# Altium schematic sheet PowerPanel_3_LowV_Monitors.SchDoc
size 594 x 420 mm; SheetNumber: 4; SheetTotal: 6
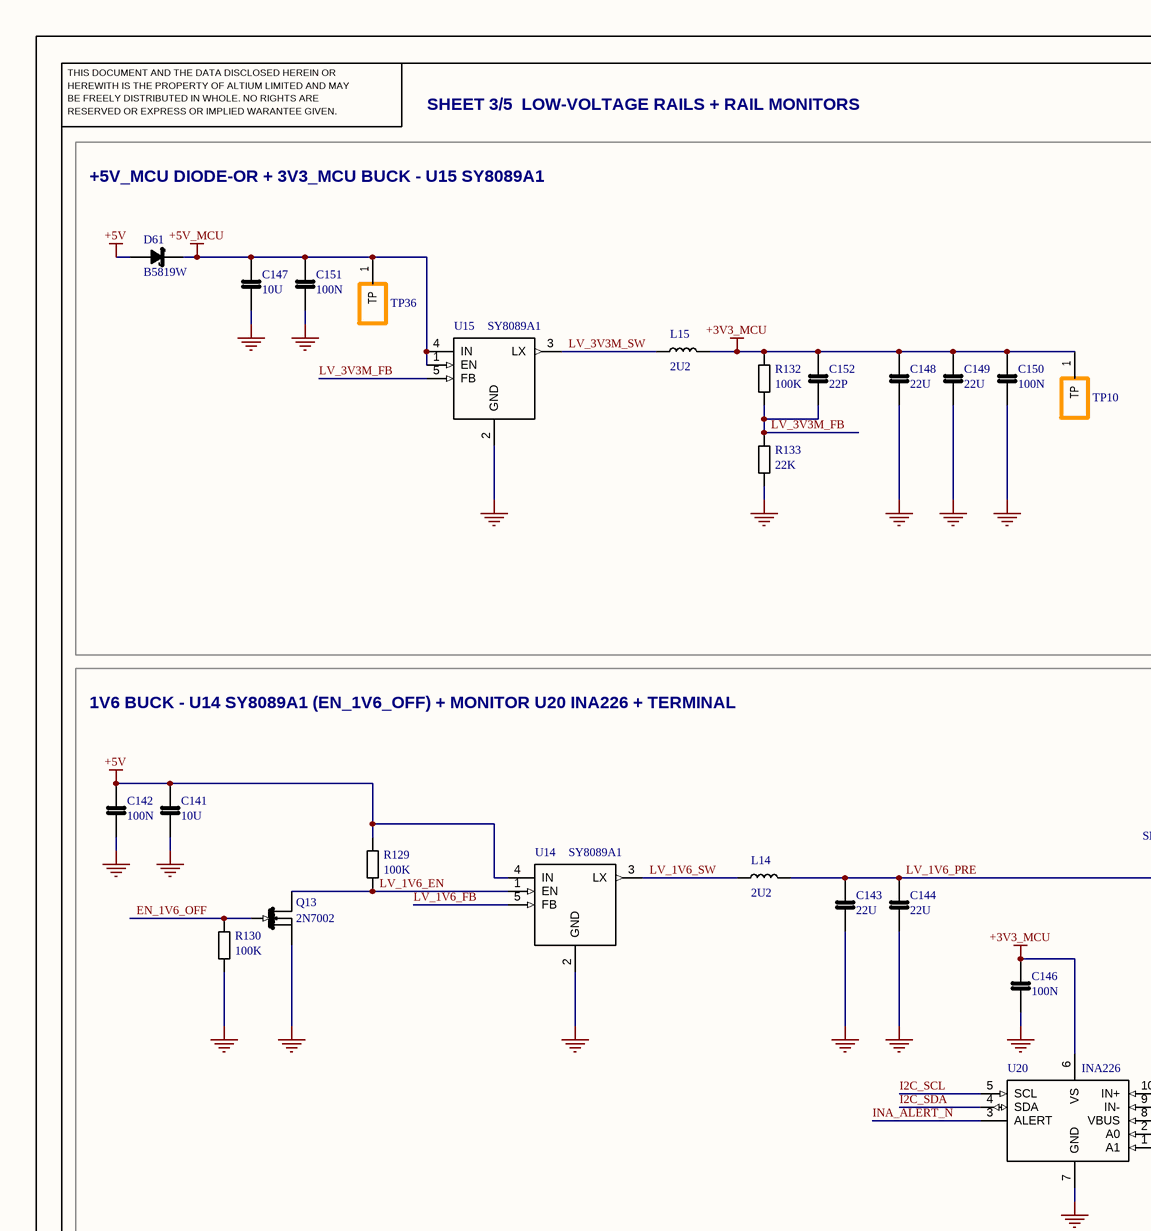
[diagram p0: PowerPanel_3_LowV_Monitors.SchDoc, top left]
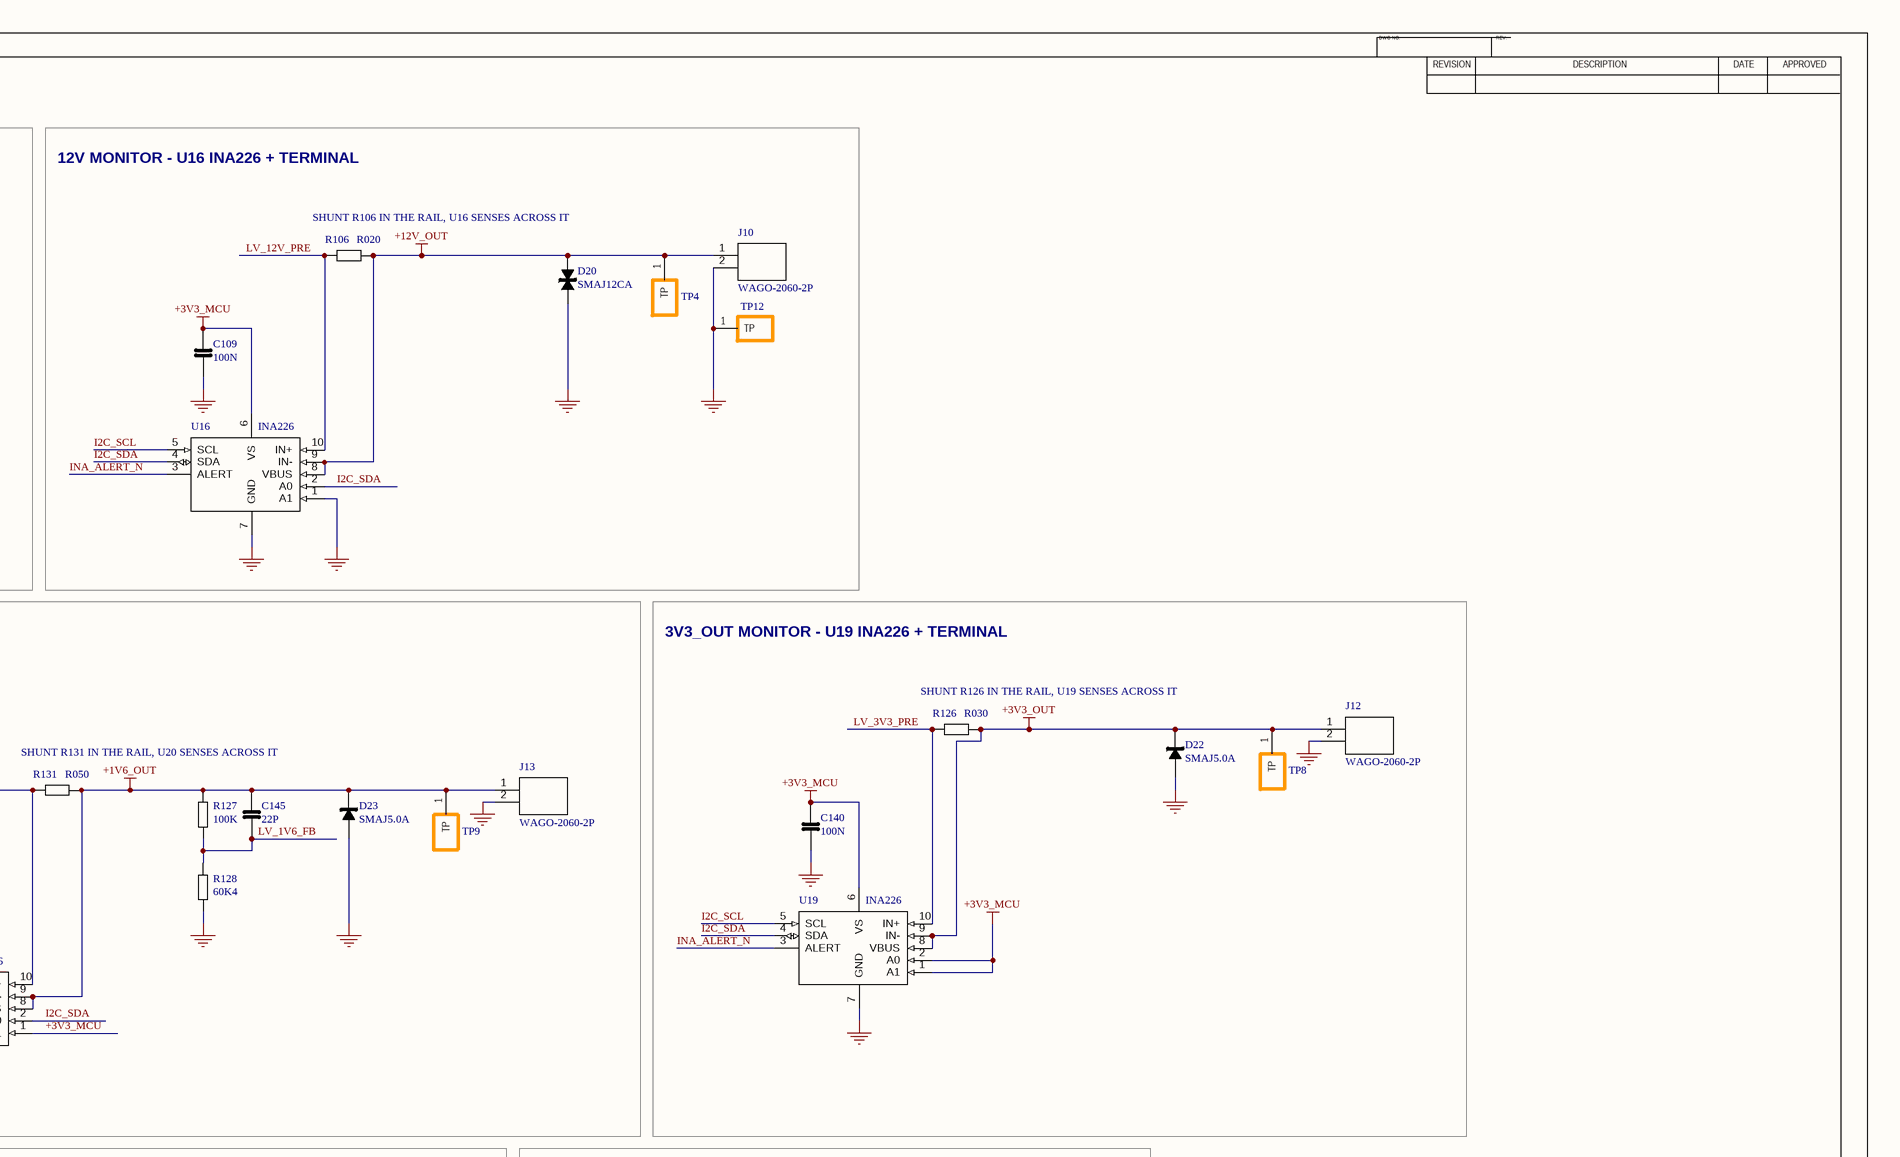
[diagram p1: PowerPanel_3_LowV_Monitors.SchDoc, top right]
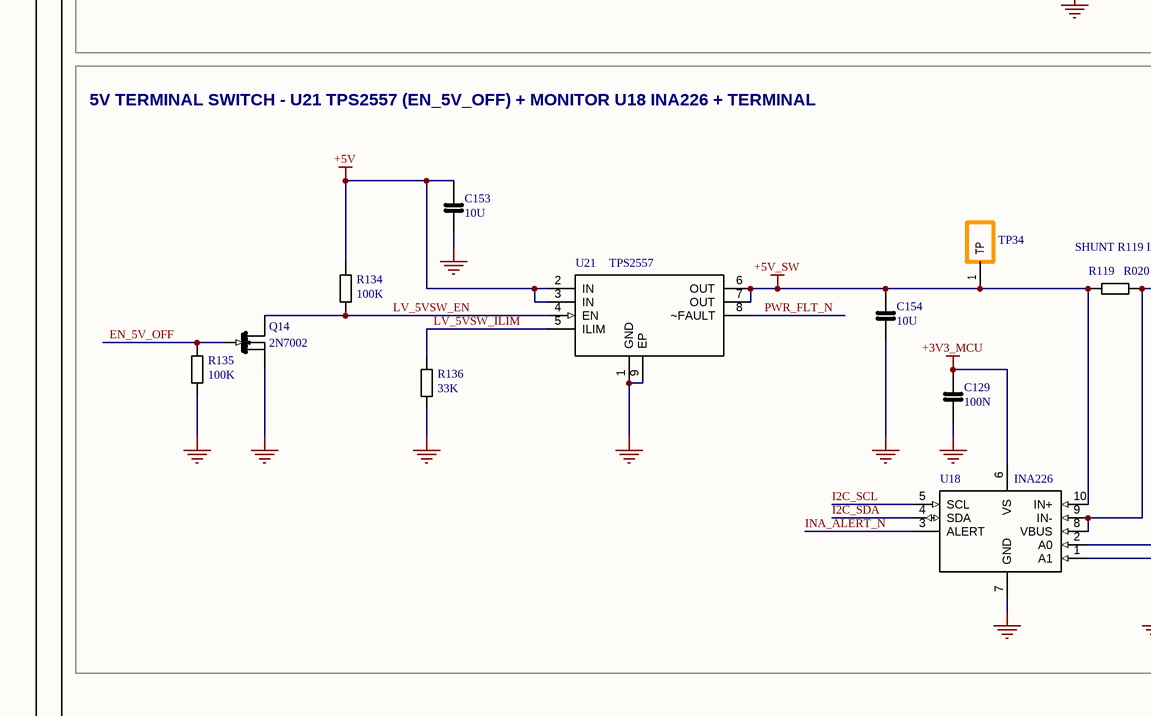
[diagram p2: PowerPanel_3_LowV_Monitors.SchDoc, bottom left]
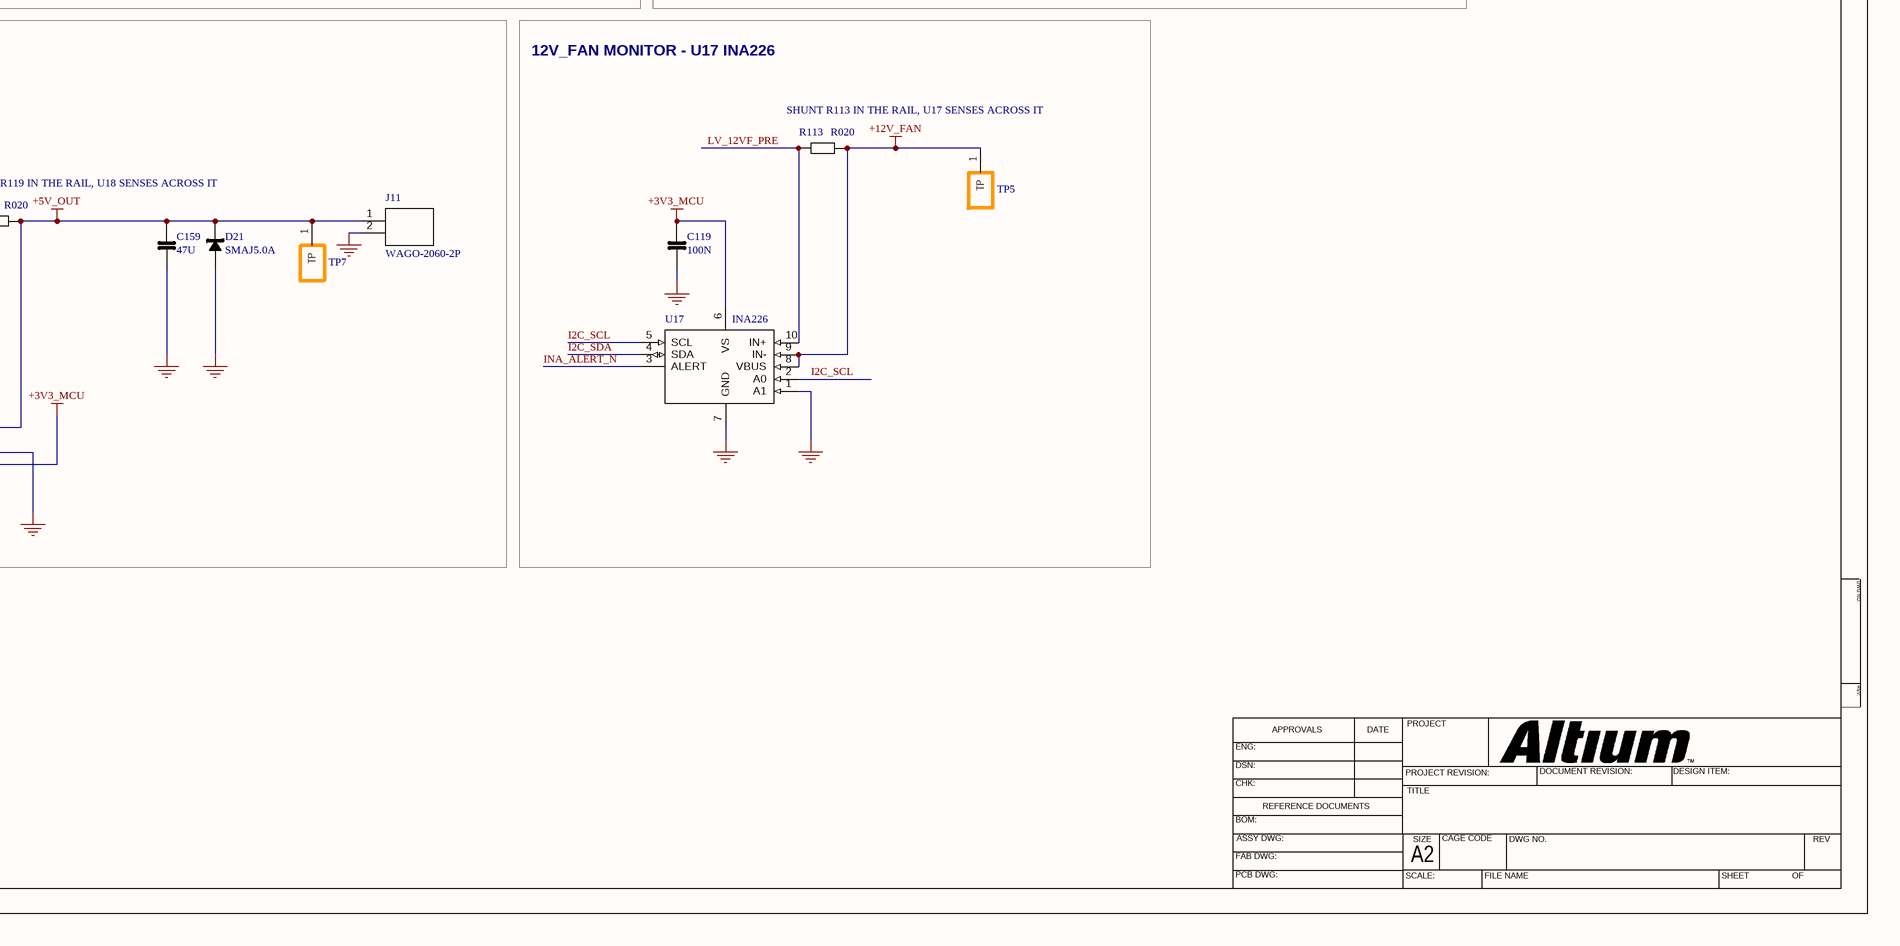
[diagram p3: PowerPanel_3_LowV_Monitors.SchDoc, bottom right]

## Parts
C109  100N  [CAP0603]
C119  100N  [CAP0603]
C129  100N  [CAP0603]
C140  100N  [CAP0603]
C141  10U  [CAP0805]
C142  100N  [CAP0603]
C143  22U  [CAP0805]
C144  22U  [CAP0805]
C145  22P  [CAP0603]
C146  100N  [CAP0603]
C147  10U  [CAP0805]
C148  22U  [CAP0805]
C149  22U  [CAP0805]
C150  100N  [CAP0603]
C151  100N  [CAP0603]
C152  22P  [CAP0603]
C153  10U  [CAP0805]
C154  10U  [CAP0805]
C159  47U  [CAP1206]
D20  SMAJ12CA  [SMA]
D21  SMAJ5.0A  [SMA]
D22  SMAJ5.0A  [SMA]
D23  SMAJ5.0A  [SMA]
D61  B5819W  [SOD-123]
J10  WAGO-2060-2P  [TERM_WAGO_2060-452]
J11  WAGO-2060-2P  [TERM_WAGO_2060-452]
J12  WAGO-2060-2P  [TERM_WAGO_2060-452]
J13  WAGO-2060-2P  [TERM_WAGO_2060-452]
L14  2U2  [L_4030]
L15  2U2  [L_4030]
Q13  2N7002  [SOT-23-3]
Q14  2N7002  [SOT-23-3]
R106  R020  [R1206]
R113  R020  [R1206]
R119  R020  [R1206]
R126  R030  [R1206]
R127  100K  [R0603]
R128  60K4  [R0603]
R129  100K  [R0603]
R130  100K  [R0603]
R131  R050  [R1206]
R132  100K  [R0603]
R133  22K  [R0603]
R134  100K  [R0603]
R135  100K  [R0603]
R136  33K  [R0603]
TP4  TP  [TESTPOINT]  (value not drawn)
TP5  TP  [TESTPOINT]  (value not drawn)
TP7  TP  [TESTPOINT]  (value not drawn)
TP8  TP  [TESTPOINT]  (value not drawn)
TP9  TP  [TESTPOINT]  (value not drawn)
TP10  TP  [TESTPOINT]  (value not drawn)
TP12  TP  [TESTPOINT]  (value not drawn)
TP34  TP  [TESTPOINT]  (value not drawn)
TP36  TP  [TESTPOINT]  (value not drawn)
U14  SY8089A1  [SOT-23-5]
U15  SY8089A1  [SOT-23-5]
U16  INA226  [MSOP-10]
U17  INA226  [MSOP-10]
U18  INA226  [MSOP-10]
U19  INA226  [MSOP-10]
U20  INA226  [MSOP-10]
U21  TPS2557  [VSON-8_3X3_EP]

## Blocks framed on the sheet
+5V_MCU DIODE-OR + 3V3_MCU BUCK - U15 SY8089A1: C147-C152 D61 L15 R132 R133 TP10 TP36 U15
12V MONITOR - U16 INA226 + TERMINAL: C109 D20 J10 R106 TP4 TP12 U16
SHUNT R131 IN THE RAIL, U20 SENSES ACROSS IT: C141-C146 D23 J13 L14 Q13 R127-R131 TP9 U14 U20
3V3_OUT MONITOR - U19 INA226 + TERMINAL: C140 D22 J12 R126 TP8 U19
SHUNT R119 IN THE RAIL, U18 SENSES ACROSS IT: C129 C153 C154 C159 D21 J11 Q14 R119 R134-R136 TP7 TP34 U18 U21
12V_FAN MONITOR - U17 INA226: C119 R113 TP5 U17

## Nets
+1V6_OUT: C145.1 D23.1(K) J13.1 R127.1 R131.2 TP9.1(TP) U20.8(VBUS) U20.9(IN-)
+3V3_MCU: C109.1 C119.1 C129.1 C140.1 C146.1 C148.1 C149.1 C150.1 C152.1 L15.2 R132.1 TP10.1(TP) U16.6(VS) U17.6(VS) U18.1(A1) U18.6(VS) U19.1(A1) U19.2(A0) U19.6(VS) U20.1(A1) U20.6(VS)
+3V3_OUT: D22.1(K) J12.1 R126.2 TP8.1(TP) U19.8(VBUS) U19.9(IN-)
+5V: C141.1 C142.1 C153.1 D61.2(A) R129.1 R134.1 U14.4(IN) U21.2(IN) U21.3(IN)
+5V_MCU: C147.1 C151.1 D61.1(K) TP36.1(TP) U15.1(EN) U15.4(IN)
+5V_OUT: C159.1 D21.1(K) J11.1 R119.2 TP7.1(TP) U18.8(VBUS) U18.9(IN-)
+5V_SW: C154.1 R119.1 TP34.1(TP) U18.10(IN+) U21.6(OUT) U21.7(OUT)
+12V_FAN: R113.2 TP5.1(TP) U17.8(VBUS) U17.9(IN-)
+12V_OUT: D20.1 J10.1 R106.2 TP4.1(TP) U16.8(VBUS) U16.9(IN-)
GND: C109.2 C119.2 C129.2 C140.2 C141.2 C142.2 C143.2 C144.2 C146.2 C147.2 C148.2 C149.2 C150.2 C151.2 C153.2 C154.2 C159.2 D20.2 D21.2(A) D22.2(A) D23.2(A) J10.2 J11.2 J12.2 J13.2 Q13.2(S) Q14.2(S) R128.2 R130.2 R133.2 R135.2 R136.2 TP12.1(TP) U14.2(GND) U15.2(GND) U16.1(A1) U16.7(GND) U17.1(A1) U17.7(GND) U18.2(A0) U18.7(GND) U19.7(GND) U20.7(GND) U21.1(GND) U21.9(EP)
EN_1V6_OFF: Q13.1(G) R130.1
EN_5V_OFF: Q14.1(G) R135.1
I2C_SCL: U16.5(SCL) U17.2(A0) U17.5(SCL) U18.5(SCL) U19.5(SCL) U20.5(SCL)
I2C_SDA: U16.2(A0) U16.4(SDA) U17.4(SDA) U18.4(SDA) U19.4(SDA) U20.2(A0) U20.4(SDA)
INA_ALERT_N: U16.3(ALERT) U17.3(ALERT) U18.3(ALERT) U19.3(ALERT) U20.3(ALERT)
LV_1V6_EN: Q13.3(D) R129.2 U14.1(EN)
LV_1V6_FB: C145.2 R127.2 R128.1 U14.5(FB)
LV_1V6_PRE: C143.1 C144.1 L14.2 R131.1 U20.10(IN+)
LV_1V6_SW: L14.1 U14.3(LX)
LV_3V3_PRE: R126.1 U19.10(IN+)
LV_3V3M_FB: C152.2 R132.2 R133.1 U15.5(FB)
LV_3V3M_SW: L15.1 U15.3(LX)
LV_5VSW_EN: Q14.3(D) R134.2 U21.4(EN)
LV_5VSW_ILIM: R136.1 U21.5(ILIM)
LV_12V_PRE: R106.1 U16.10(IN+)
LV_12VF_PRE: R113.1 U17.10(IN+)
PWR_FLT_N: U21.8(~FAULT)

## Notes on the sheet
- DWG NO:
- REV:
- THIS DOCUMENT AND THE DATA DISCLOSED HEREIN OR
- HEREWITH IS THE PROPERTY OF ALTIUM LIMITED AND MAY
- BE FREELY DISTRIBUTED IN WHOLE. NO RIGHTS ARE
- RESERVED OR EXPRESS OR IMPLIED WARANTEE GIVEN.
- SHEET 3/5  LOW-VOLTAGE RAILS + RAIL MONITORS
- REVISION
- DESCRIPTION
- DATE
- APPROVED
- SHUNT R106 IN THE RAIL, U16 SENSES ACROSS IT
- 1V6 BUCK - U14 SY8089A1 (EN_1V6_OFF) + MONITOR U20 INA226 + TERMINAL
- (near R126) SHUNT R126 IN THE RAIL, U19 SENSES ACROSS IT
- 5V TERMINAL SWITCH - U21 TPS2557 (EN_5V_OFF) + MONITOR U18 INA226 + TERMINAL
- (near R113) SHUNT R113 IN THE RAIL, U17 SENSES ACROSS IT
- ENG:
- APPROVALS
- PROJECT
- DSN:
- CHK:
- REFERENCE DOCUMENTS
- PROJECT REVISION:
- TITLE
- DOCUMENT REVISION:
- DESIGN ITEM:
- BOM:
- FAB DWG:
- PCB DWG:
- ASSY DWG:
- SCALE:
- A2
- SIZE
- CAGE CODE
- FILE NAME
- DWG NO.
- SHEET
- OF
- REV

## Library data of the parts
C109 C119 C129 C140 C142 C146 C150 C151 = C_100N_0603: CAP // 100N // 50V // X7R // 0603; MFR: YAGEO; MPN: CC0603KRX7R9BB104; Value: 100N; LCSC: C14663; JLC_TYPE: BASIC; JLC_CHECKED: 2026-09-29 STOCK 55887132; Datasheet: https://www.lcsc.com/datasheet/lcsc_datasheet_2211101700_YAGEO-CC0603KRX7R9BB104_C14663.pdf
C141 C147 C153 C154 = C_10U_0805: CAP // 10U // 25V // X5R // 0805; MFR: Samsung Electro-Mechanics; MPN: CL21A106KAYNNNE; Value: 10U; LCSC: C15850; JLC_TYPE: BASIC; JLC_CHECKED: 2026-09-29 STOCK 5145754; Datasheet: https://www.lcsc.com/datasheet/lcsc_datasheet_2304140030_Samsung-Electro-Mechanics-CL21A106KAYNNNE_C15850.pdf
C143 C144 C148 C149 = C_22U_0805: CAP // 22U // 25V // X5R // 0805; MFR: Samsung Electro-Mechanics; MPN: CL21A226MAQNNNE; Value: 22U; LCSC: C45783; JLC_TYPE: BASIC; JLC_CHECKED: 2026-09-29 STOCK 4065880; Datasheet: https://www.lcsc.com/datasheet/lcsc_datasheet_2304140030_Samsung-Electro-Mechanics-CL21A226MAQNNNE_C45783.pdf
C145 C152 = C_22P_0603: CAP // 22P // 50V // C0G // 0603; MFR: Samsung Electro-Mechanics; MPN: CL10C220JB8NNNC; Value: 22P; LCSC: C1653; JLC_TYPE: BASIC; JLC_CHECKED: 2026-09-29 STOCK 3038075; Datasheet: https://www.lcsc.com/datasheet/lcsc_datasheet_2304140030_Samsung-Electro-Mechanics-CL10C220JB8NNNC_C1653.pdf
C159 = C_47U_1206: CAP // 47U // 10V // X5R // 1206; MFR: Samsung Electro-Mechanics; MPN: CL31A476MPHNNNE; Value: 47U; LCSC: C96123; JLC_TYPE: BASIC; JLC_CHECKED: 2026-09-29 STOCK 316228; Datasheet: https://www.lcsc.com/datasheet/lcsc_datasheet_2304140030_Samsung-Electro-Mechanics-CL31A476MPHNNNE_C96123.pdf
D20 = D_SMAJ12CA: TVS // 12V BI // 400W // 19V9 CLAMP // SMA; MFR: hongjiacheng; Value: 12V; MPN: SMAJ12CA; LCSC: C19077532; JLC_TYPE: PREFERRED; JLC_CHECKED: 2026-09-29 STOCK 274481; Datasheet: https://wmsc.lcsc.com/wmsc/upload/file/pdf/v2/lcsc/2403232245_hongjiacheng-SMAJ12CA_C19077532.pdf
D21-D23 = D_SMAJ5V0A: TVS // 5V0 UNI // 400W // 9V2 CLAMP // SMA; MFR: hongjiacheng; Value: 5V0; MPN: SMAJ5.0A; LCSC: C19077523; JLC_TYPE: PREFERRED; JLC_CHECKED: 2026-09-29 STOCK 321801; Datasheet: https://wmsc.lcsc.com/wmsc/upload/file/pdf/v2/lcsc/2312041002_hongjiacheng-SMAJ5-0A_C19077523.pdf
D61 = D_B5819W: SCHOTTKY // 40V 1A // 600MV // SOD-123; MFR: Jiangsu Changjing Electronics Technology Co., Ltd.; MPN: B5819W SL; Value: B5819W; LCSC: C8598; JLC_TYPE: BASIC; JLC_CHECKED: 2026-09-29 STOCK 545116; Datasheet: https://www.lcsc.com/datasheet/lcsc_datasheet_2304140030_Jiangsu-Changjing-Electronics-Technology-Co---Ltd--B5819W-SL_C8598.pdf
J10-J13 = J_TERM-SPRING_2P_4.0_SMD: CONN // WAGO 2060 PUSH-IN // 2P // 4.0MM // 9A 320V // SMD; MPN: 2060-452/998-404; Value: 2P; MFR: WAGO; LCSC: C2765055; JLC_TYPE: EXTENDED; JLC_CHECKED: 2026-10-03 STOCK 27983; Datasheet: https://wmsc.lcsc.com/wmsc/upload/file/pdf/v2/lcsc/2410121253_WAGO-2060-452-998-404_C2765055.pdf
L14 L15 = L_2U2_4030: IND // 2U2 // ISAT 4.9A // IRMS 2.95A // 39MR // 4030 SHIELDED; MFR: cjiang (Changjiang Microelectronics Tech); MPN: FNR4030S2R2MT; Value: 2U2; LCSC: C167869; JLC_TYPE: EXTENDED; JLC_CHECKED: 2026-09-29 STOCK 67195; Datasheet: https://www.lcsc.com/datasheet/lcsc_datasheet_2304140030_cjiang--Changjiang-Microelectronics-Tech-FNR4030S2R2MT_C167869.pdf
Q13 Q14 = Q_2N7002: NMOS // 60V // 115MA // 5R@10V // SOT-23; MFR: Jiangsu Changjing Electronics Technology Co., Ltd.; Value: 2N7002; MPN: 2N7002; LCSC: C8545; JLC_TYPE: BASIC; JLC_CHECKED: 2026-09-29 STOCK 1679919; Datasheet: https://www.lcsc.com/datasheet/lcsc_datasheet_2304140030_Jiangsu-Changjing-Electronics-Technology-Co---Ltd--2N7002_C8545.pdf
R106 R113 R119 = R_R020_1206: SHUNT // R020 // 1% // 1W // 70PPM // 1206; MFR: PSA(Prosperity Dielectrics); MPN: FMF06FTHR020-LH; Value: R020; LCSC: C371097; JLC_TYPE: EXTENDED; JLC_CHECKED: 2026-10-03 STOCK 16724; Datasheet: https://www.lcsc.com/datasheet/lcsc_datasheet_2304140030_PSA-Prosperity-Dielectrics-FMF06FTHR020-LH_C371097.pdf
R126 = R_R030_1206: SHUNT // R030 // 1% // 1W // 50PPM // 1206; MFR: Milliohm; MPN: HoYLR1206-1W-30mR-1%; Value: R030; LCSC: C5375399; JLC_TYPE: EXTENDED; JLC_CHECKED: 2026-10-03 STOCK 84887; Datasheet: https://wmsc.lcsc.com/wmsc/upload/file/pdf/v2/lcsc/2305061708_Milliohm-HoYLR1206-1W-40mR-1-_C5375400.pdf
R127 R129 R130 R132 R134 R135 = R_100K_0603: RES // 100K // 1% // 100MW // 0603; MFR: UNI-ROYAL(Uniroyal Elec); MPN: 0603WAF1003T5E; Value: 100K; LCSC: C25803; JLC_TYPE: BASIC; JLC_CHECKED: 2026-09-29 STOCK 22429301; Datasheet: https://www.lcsc.com/datasheet/lcsc_datasheet_2206010045_UNI-ROYAL-Uniroyal-Elec-0603WAF1003T5E_C25803.pdf
R128 = R_60K4_0603: RES // 60K4 // 1% // 100MW // 0603; MFR: UNI-ROYAL(Uniroyal Elec); MPN: 0603WAF6042T5E; Value: 60K4; LCSC: C23089; JLC_TYPE: EXTENDED; JLC_CHECKED: 2026-10-03 STOCK 92785; Datasheet: https://www.lcsc.com/datasheet/lcsc_datasheet_2206010116_UNI-ROYAL-Uniroyal-Elec-0603WAF6042T5E_C23089.pdf
R131 = R_R050_1206: SHUNT // R050 // 1% // 1W // 1206; MFR: Shenzhen Yezhan Elec.; MPN: YLRY06-1-50F; Value: R050; LCSC: C20608719; JLC_TYPE: EXTENDED; JLC_CHECKED: 2026-09-29 STOCK 79173; Datasheet: https://wmsc.lcsc.com/wmsc/upload/file/pdf/v2/lcsc/2401171159_Shenzhen-Yezhan-Elec--YLRY06-1-50F_C20608719.pdf
R133 = R_22K_0603: RES // 22K // 1% // 100MW // 0603; MFR: UNI-ROYAL(Uniroyal Elec); MPN: 0603WAF2202T5E; Value: 22K; LCSC: C31850; JLC_TYPE: BASIC; JLC_CHECKED: 2026-09-29 STOCK 3737803; Datasheet: https://www.lcsc.com/datasheet/lcsc_datasheet_2206010030_UNI-ROYAL-Uniroyal-Elec-0603WAF2202T5E_C31850.pdf
R136 = R_33K_0603: RES // 33K // 1% // 100MW // 0603; MFR: UNI-ROYAL(Uniroyal Elec); MPN: 0603WAF3302T5E; Value: 33K; LCSC: C4216; JLC_TYPE: BASIC; JLC_CHECKED: 2026-10-03 STOCK 3235651; Datasheet: https://www.lcsc.com/datasheet/lcsc_datasheet_2206010230_UNI-ROYAL-Uniroyal-Elec-0603WAF3302T5E_C4216.pdf
TP4 TP5 TP7-TP10 TP12 TP34 TP36 = TP: TP // SMD PAD // 1.5MM; MPN: TEST POINT (NOT A BOM PART)
U14 U15 = U_SY8089A1AAC: BUCK // 2V5-5V5 IN // 2A // 1M5HZ // SYNC // SOT-23-5; MFR: Silergy Corp; Value: ADJ; MPN: SY8089A1AAC; LCSC: C479074; JLC_TYPE: EXTENDED; JLC_CHECKED: 2026-09-29 STOCK 103249; Datasheet: https://www.lcsc.com/datasheet/lcsc_datasheet_2001171834_Silergy-Corp-SY8089A1AAC_C479074.pdf
U16-U20 = U_INA226: PWR MON // 36V // 16BIT I2C // ALERT // VSSOP-10; MFR: Texas Instruments; MPN: INA226AIDGSR; Value: INA226; LCSC: C49851; JLC_TYPE: EXTENDED; JLC_CHECKED: 2026-09-29 STOCK 48191; Datasheet: https://www.lcsc.com/datasheet/lcsc_datasheet_2312041157_Texas-Instruments-INA226AIDGSR_C49851.pdf
U21 = U_TPS2557DRB: PWR SWITCH // 2V5-6V5 // 5A ADJ ILIM // 22MR // VSON-8 3X3; MFR: Texas Instruments; MPN: TPS2557DRBR; Value: TPS2557; LCSC: C130056; JLC_TYPE: EXTENDED; JLC_CHECKED: 2026-10-03 STOCK 1935; Datasheet: https://www.ti.com/lit/ds/symlink/tps2557.pdf